# Altium project Master-Board-v2.0.PrjPcb (part 4 of 11)
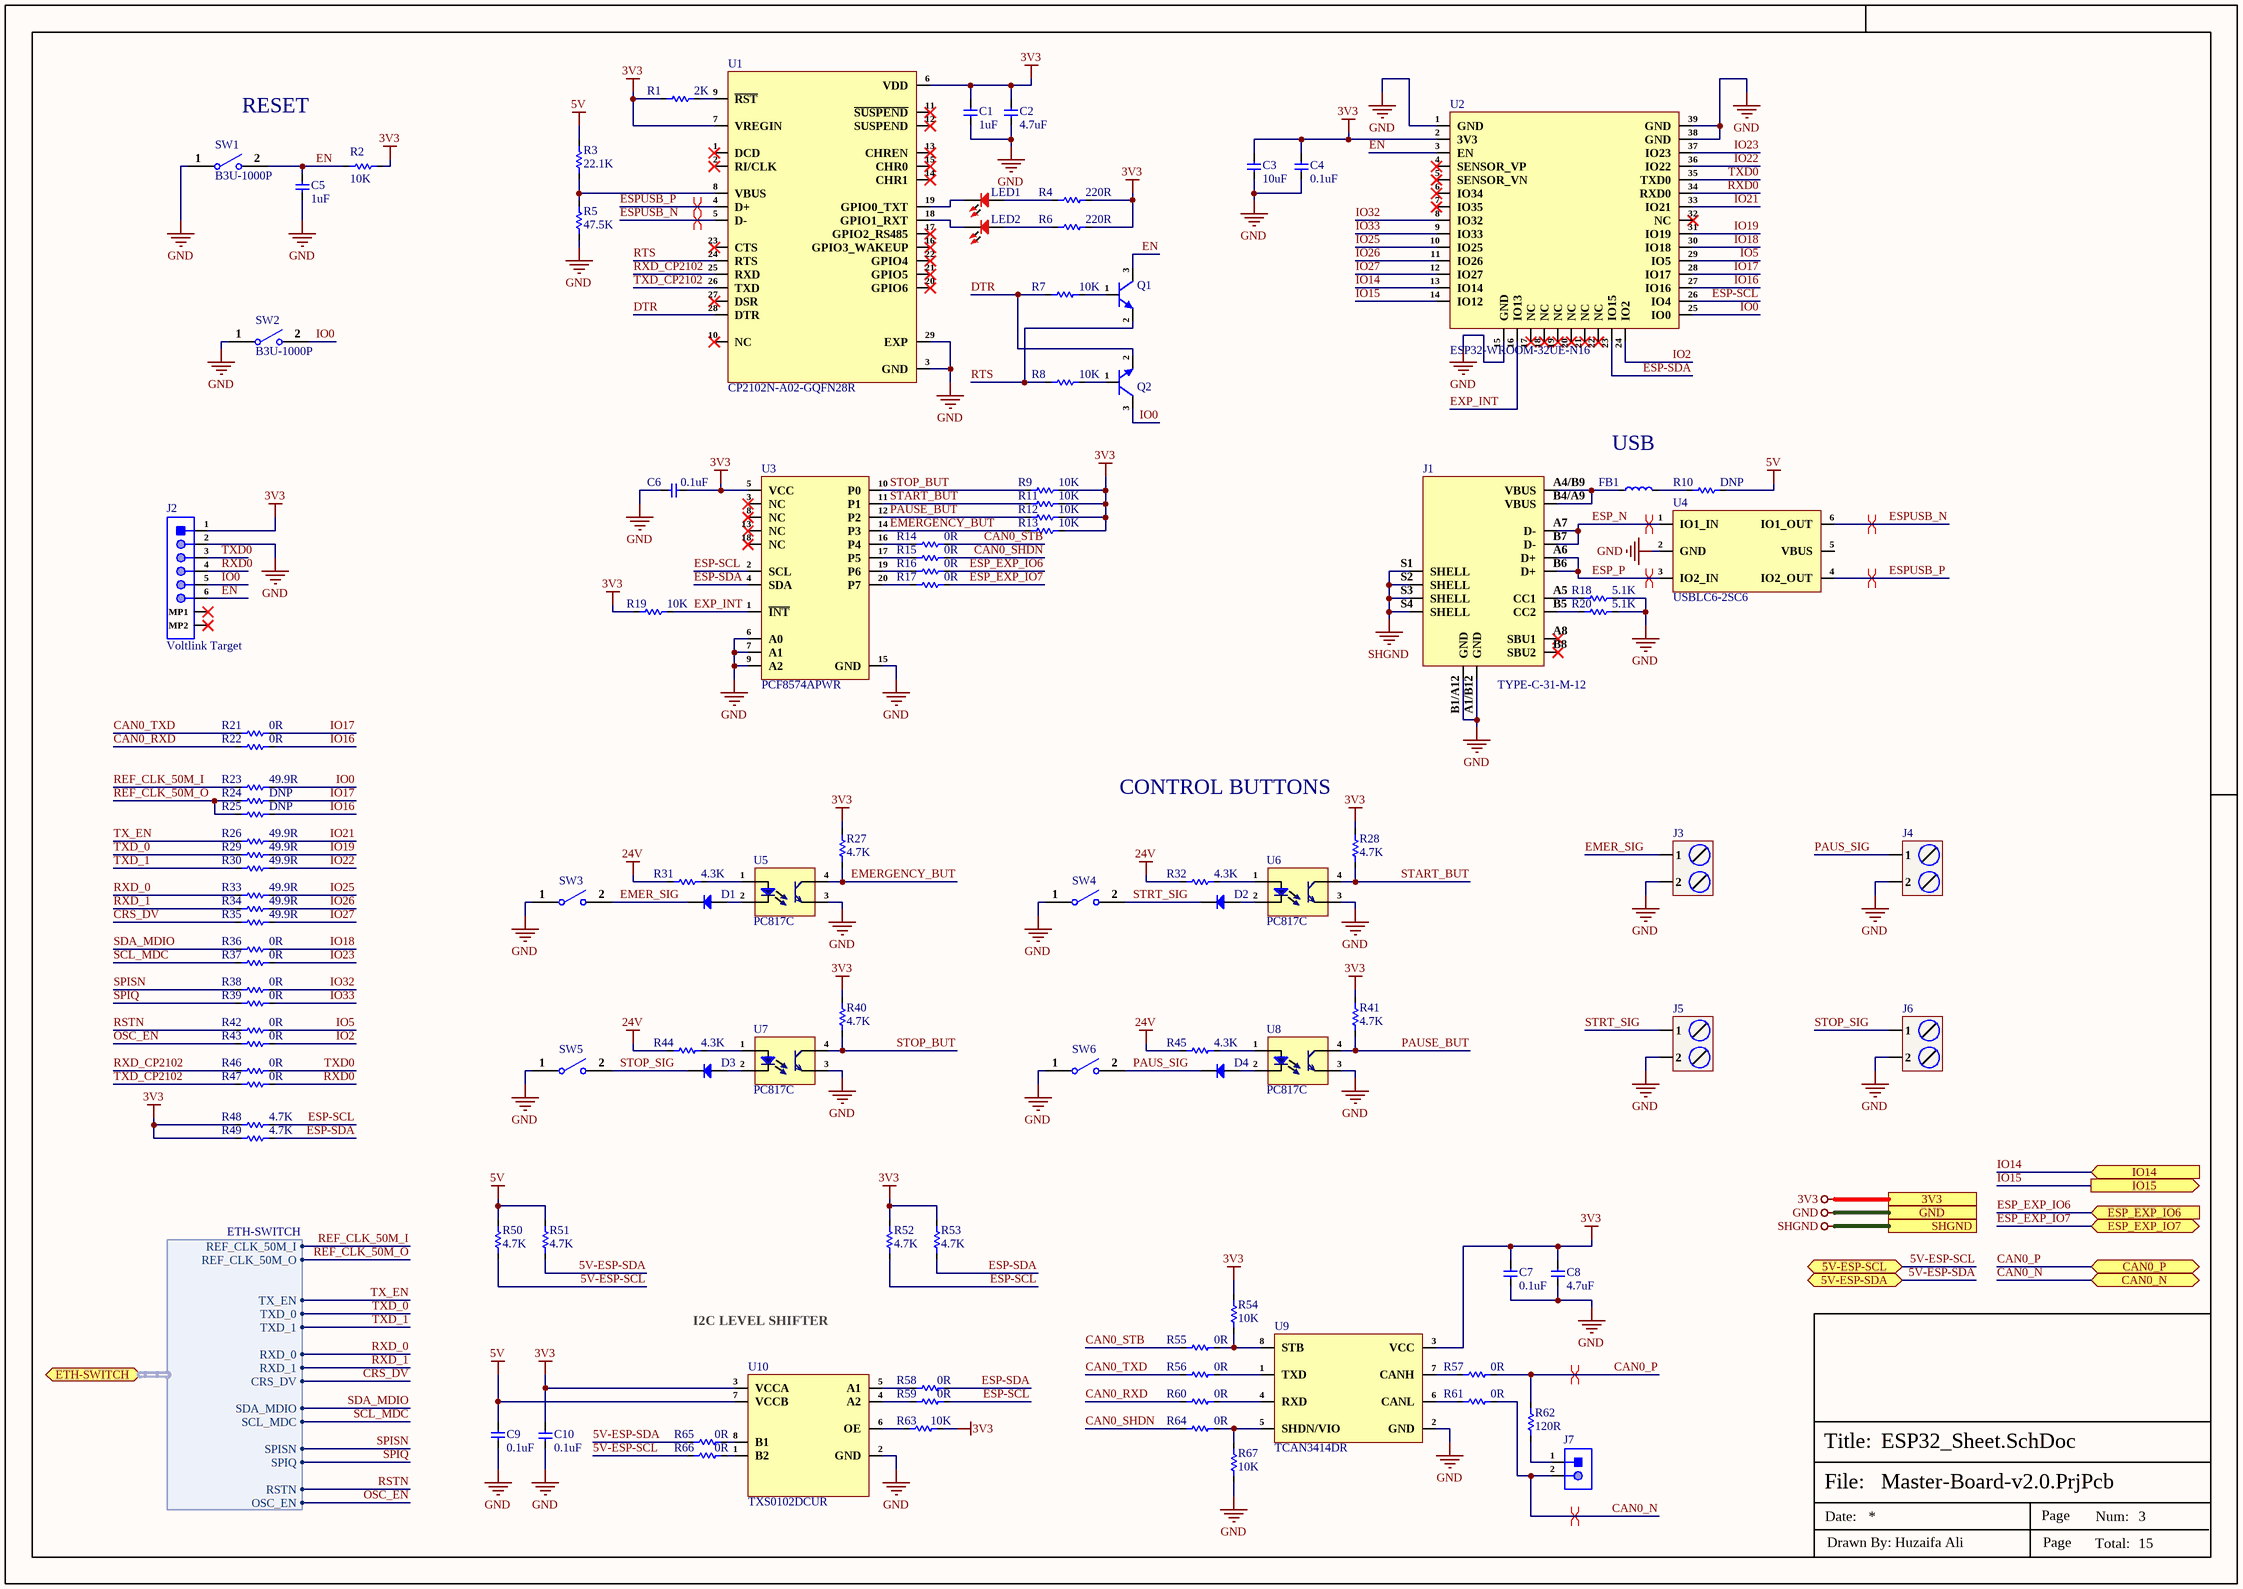
[diagram p104: ESP32_Sheet.SchDoc]

## Sheet ESP32_Sheet.SchDoc (continued)

### Library data of the parts (continued)
U5-U8 = PC817C: 70V 5kV 50mA 100mV@1mA,20mA 1 6V 1.2V DC SMD-4 Transistor Output Optocoupler ROHS; Manufacturer: Slkor; Item Type: IC; Manufacturer Part Number: PC817C; Package: SMD-4; LCSC Part Number: C2936043; ComponentLink1Description: LCSC; ComponentLink1URL: https://www.lcsc.com/product-detail/Transistor-Output-Optocoupler_Slkor-SLKORMICRO-Elec-PC817C_C2936043.html
U9 = TCAN3414DR: IC TRANSCEIVER HALF 1/1 8SOIC; Manufacturer: Texas Instruments; Supplier: Mouser; LCSC Part Number: C22396693; Manufacturer Part Number: TCAN3414DR; RoHS: No; Item Type: IC; Stock: 201; Pricing: 1=1.55, 10=1.1, 50=1.1, 100=0.895, 1000=0.763, 10000=0.681 (USD); Case/Package: SOIC; Pins: 8; Length: 4.9mm; Width: 3.91mm; Height: 1.75mm; Thickness: 1.58mm
U10 = TXS0102DCUR: IC TRANSLTR BIDIRECTIONAL 8VSSOP; Manufacturer: Texas Instruments; Number of Outputs: 2NUMBER; Number of Inputs: 2; Nominal Supply Current: 14.4uA; Output Current: 1A; Min Supply Voltage: 1.65V; Max Supply Voltage: 5.5V; Data Rate: 24Mbps; Propagation Delay: 4.6ns; Logic Function: Translator; Turn-On Delay Time: 260ns; High Level Output Current: -20uA; Low Level Output Current: 1mA; Number of Circuits: 1; Supplier: Mouser; Supplier Part Number: 595-TXS0102DCUR; Manufacturer Part Number: TXS0102DCUR; RoHS: Yes; Category: Voltage Level Shifters; Stock: 149802; Pricing: 1=0.89, 10=0.739, 50=0.739, 100=0.561, 1000=0.383, 10000=0.313 (USD); Case/Package: VSSOP; Pins: 8; Weight: 0.000339oz; Min Operating Temperature: -40°C; Max Operating Temperature: 85°C; Package Quantity: 3000; Number of Channels: 2; Packaging: Tape and Reel; Number of Bits: 2; Quiescent Current: 14.4uA; Series: -; Channel Type: Bidirectional; Length: 2.3mm; Width: 2mm; Height: 900um; Thickness: 850um; Radiation Hardening: No; Reach SVHC Compliant: No; Lead Free: Lead Free; RoHS Compliant: Yes; ComponentLink1URL: https://datasheet.ciiva.com/22653/1846850-22653373.pdf?src-supplier=Farnell; ComponentLink1Description: https://datasheet.ciiva.com/22653/1846850-22653373.pdf?src-supplier=Farnell; ComponentLink2URL: https://datasheet.ciiva.com/15096/getdatasheetpartid-118249-15096172.pdf?src-supplier=Verical; ComponentLink2Description: https://datasheet.ciiva.com/15096/getdatasheetpartid-118249-15096172.pdf?src-supplier=Verical; ComponentLink3URL: https://datasheet.ciiva.com/1508/1857232-1508821.pdf?src-supplier=Element14; ComponentLink3Description: https://datasheet.ciiva.com/1508/1857232-1508821.pdf?src-supplier=Element14; ComponentLink4URL: https://datasheet.ciiva.com/28499/1863639-28499676.pdf?src-supplier=Element14; ComponentLink4Description: https://datasheet.ciiva.com/28499/1863639-28499676.pdf?src-supplier=Element14; ComponentLink5URL: https://datasheet.ciiva.com/46395/1863639-46395871.pdf?src-supplier=Element14; ComponentLink5Description: https://datasheet.ciiva.com/46395/1863639-46395871.pdf?src-supplier=Element14; ComponentLink6URL: https://datasheet.ciiva.com/1899/txs0102-1899369.pdf?src-supplier=Digikey; ComponentLink6Description: https://datasheet.ciiva.com/1899/txs0102-1899369.pdf?src-supplier=Digikey; ComponentLink7URL: https://datasheet.ciiva.com/1899/txs0102-1899368.pdf?src-supplier=Digikey; ComponentLink7Description: https://datasheet.ciiva.com/1899/txs0102-1899368.pdf?src-supplier=Digikey; ComponentLink8URL: https://datasheet.ciiva.com/1899/txs0102-1899370.pdf?src-supplier=Digikey; ComponentLink8Description: https://datasheet.ciiva.com/1899/txs0102-1899370.pdf?src-supplier=Digikey; ComponentLink9URL: https://datasheet.ciiva.com/14287/txs0102-14287516.pdf?src-supplier=Avnet; ComponentLink9Description: https://datasheet.ciiva.com/14287/txs0102-14287516.pdf?src-supplier=Avnet; ComponentLink10URL: https://datasheet.ciiva.com/14287/txs0102-14287518.pdf?src-supplier=Avnet; ComponentLink10Description: https://datasheet.ciiva.com/14287/txs0102-14287518.pdf?src-supplier=Avnet; LCSC Part Number: C53434; Item Type: IC

## Sheet Ethernet-Sheet.SchDoc
size 420 x 297 mm; SheetNumber: 4; SheetTotal: 15
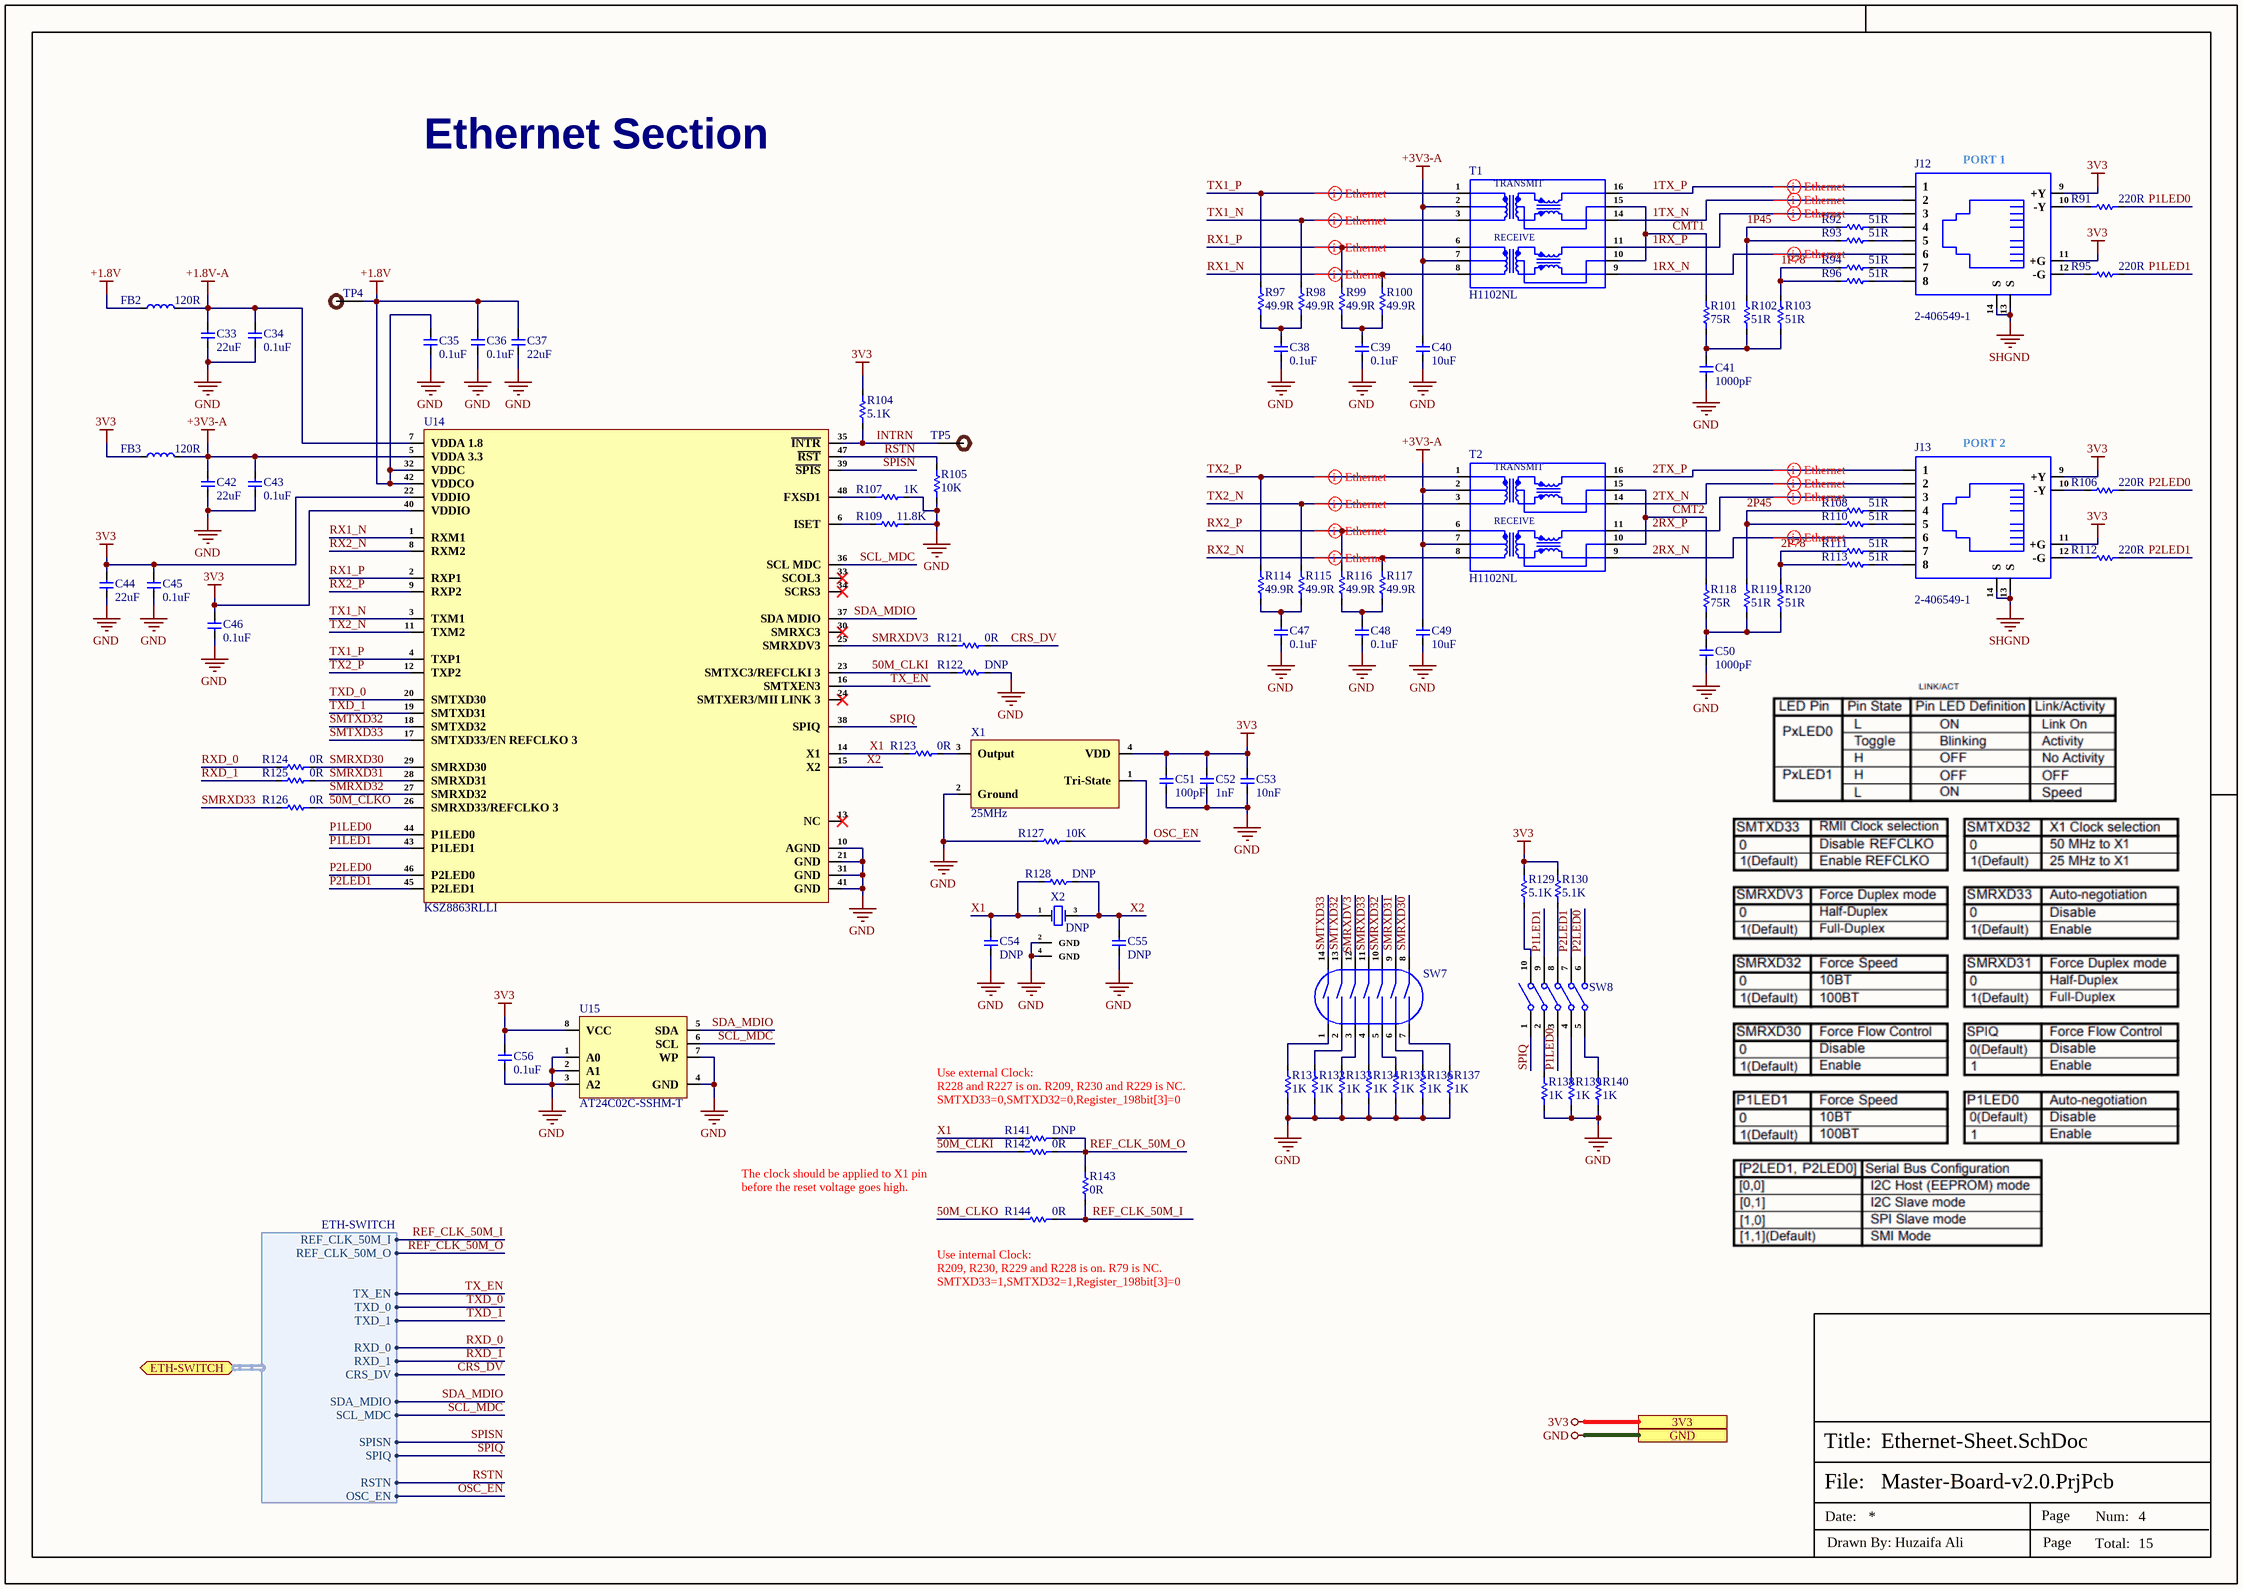
[diagram p3: Ethernet-Sheet.SchDoc]

### Parts
C33  22uF  [Cap-0805]
C34  0.1uF  [Cap-0402]
C35  0.1uF  [Cap-0402]
C36  0.1uF  [Cap-0402]
C37  22uF  [Cap-0805]
C38  0.1uF  [Cap-0402]
C39  0.1uF  [Cap-0402]
C40  10uF  [Cap-0603]
C41  1000pF  [Cap-1206]
C42  22uF  [Cap-0805]
C43  0.1uF  [Cap-0402]
C44  22uF  [Cap-0805]
C45  0.1uF  [Cap-0402]
C46  0.1uF  [Cap-0402]
C47  0.1uF  [Cap-0402]
C48  0.1uF  [Cap-0402]
C49  10uF  [Cap-0603]
C50  1000pF  [Cap-1206]
C51  100pF  [Cap-0402]
C52  1nF  [Cap-0402]
C53  10nF  [Cap-0402]
C54  DNP  [Cap-0402]
C55  DNP  [Cap-0402]
C56  0.1uF  [Cap-0402]
FB2  120R  [IND-0603 (1608 Metric)]
FB3  120R  [IND-0603 (1608 Metric)]
J12  2-406549-1  [2-406549-1]
J13  2-406549-1  [2-406549-1]
R91  220R  [Res-0603]
R92  51R  [Res-0603]
R93  51R  [Res-0603]
R94  51R  [Res-0603]
R95  220R  [Res-0603]
R96  51R  [Res-0603]
R97  49.9R  [Res-0603]
R98  49.9R  [Res-0603]
R99  49.9R  [Res-0603]
R100  49.9R  [Res-0603]
R101  75R  [Res-0603]
R102  51R  [Res-0603]
R103  51R  [Res-0603]
R104  5.1K  [Res-0402]
R105  10K  [Res-0402]
R106  220R  [Res-0603]
R107  1K  [Res-0402]
R108  51R  [Res-0603]
R109  11.8K  [Res-0603]
R110  51R  [Res-0603]
R111  51R  [Res-0603]
R112  220R  [Res-0603]
R113  51R  [Res-0603]
R114  49.9R  [Res-0603]
R115  49.9R  [Res-0603]
R116  49.9R  [Res-0603]
R117  49.9R  [Res-0603]
R118  75R  [Res-0603]
R119  51R  [Res-0603]
R120  51R  [Res-0603]
R121  0R  [Res-0402]
R122  DNP  [Res-0402]
R123  0R  [Res-0402]
R124  0R  [Res-0402]
R125  0R  [Res-0402]
R126  0R  [Res-0402]
R127  10K  [Res-0402]
R128  DNP  [Res-0402]
R129  5.1K  [Res-0402]
R130  5.1K  [Res-0402]
R131  1K  [Res-0402]
R132  1K  [Res-0402]
R133  1K  [Res-0402]
R134  1K  [Res-0402]
R135  1K  [Res-0402]
R136  1K  [Res-0402]
R137  1K  [Res-0402]
R138  1K  [Res-0402]
R139  1K  [Res-0402]
R140  1K  [Res-0402]
R141  DNP  [Res-0402]
R142  0R  [Res-0402]
R143  0R  [Res-0402]
R144  0R  [Res-0402]
SW7  DSIC07LS-P  [DSIC07LS-P]  (value not drawn)
SW8  DSIC05LS-P  [DSIC05LS-P_]  (value not drawn)
T1  H1102NL  [H1102NLT]
T2  H1102NL  [H1102NLT]
TP4  TEST POINT 0.5mm Dia  [Test-point - 0.5mm]  (value not drawn)  (no BOM)
TP5  TEST POINT 0.5mm Dia  [Test-point - 0.5mm]  (value not drawn)  (no BOM)
U14  KSZ8863RLLI  [48-LQFP (7x7)]
U15  AT24C02C-SSHM-T  [SOIC-8(0.154", 3.90mm Width)]
X1  25MHz  [SMD2520-4P]
X2  DNP  [Q22FA12800090]

### Ports
3V3 (see Top-Sheet[2B], CAN-Sheet[5D], Controller-Sheet-1[4D], Controller-Sheet-2[4D], Controller-Sheet-3[4D], DIOs-Lights-Sensors-Sheet[4D], Display-Sheet[5D], ESP32_Sheet[6D], EtherCAT-Sheet[1D], Power-Sheet[4D], RS232-Sheet[5D], RS485-Sheet[5D], STM32-USB-Sheet[4D]), ETH-SWITCH (bidir, harness ETH-SWITCH, see Top-Sheet[2B], ESP32_Sheet[1D]), GND (see Top-Sheet[2B], Analog-AIO-Sheet[5D], CAN-Sheet[6D], Controller-Sheet-1[4D], Controller-Sheet-2[4D], Controller-Sheet-3[4D], DIOs-Lights-Sensors-Sheet[4D], Display-Sheet[5D], ESP32_Sheet[6D], EtherCAT-Sheet[1D], Power-Sheet[4D], RS232-Sheet[5D], RS485-Sheet[5D], STM32-USB-Sheet[4D])

### Harnesses
ETH-SWITCH: REF_CLK_50M_I, REF_CLK_50M_O, TX_EN, TXD_0, TXD_1, RXD_0, RXD_1, CRS_DV, SDA_MDIO, SCL_MDC, SPISN, SPIQ, RSTN, OSC_EN

### Nets
3V3: C44.2 C45.2 C46.2 C51.2 C52.2 C53.2 C56.2 FB3.1 J12.9(+Y) J12.11(+G) J13.9(+Y) J13.11(+G) R104.2 R129.2 R130.2 U14.22(VDDIO) U14.40(VDDIO) U15.8(VCC) X1.4(VDD) ; port 3V3
+1.8V: C35.2 C36.2 C37.2 FB2.1 TP4.1 U14.32(VDDC) U14.42(VDDCO)
+1.8V-A: C33.2 C34.2 FB2.2 U14.7(VDDA_1.8)
+3V3-A: C40.2 C42.2 C43.2 C49.2 FB3.2 T1.2 T1.7 T2.2 T2.7 U14.5(VDDA_3.3)
GND: C33.1 C34.1 C35.1 C36.1 C37.1 C38.1 C39.1 C40.1 C41.1 C42.1 C43.1 C44.1 C45.1 C46.1 C47.1 C48.1 C49.1 C50.1 C51.1 C52.1 C53.1 C54.1 C55.1 C56.1 R105.1 R107.1 R109.2 R122.2 R127.1 R131.1 R132.1 R133.1 R134.1 R135.1 R136.1 R137.1 R138.1 R139.1 R140.1 U14.10(AGND) U14.21(GND) U14.31(GND) U14.41(GND) U15.1(A0) U15.2(A1) U15.3(A2) U15.4(GND) U15.7(WP) X1.2(Ground) X2.2(GND) X2.4(GND) ; port GND
SHGND: J12.13(S) J12.14(S) J13.13(S) J13.14(S)
1P45: R92.2 R93.2 R102.2
1P78: R94.2 R96.2 R103.2
1RX_N: J12.6 T1.9
1RX_P: J12.3 T1.11
1TX_N: J12.2 T1.14
1TX_P: J12.1 T1.16
2P45: R108.2 R110.2 R119.2
2P78: R111.2 R113.2 R120.2
2RX_N: J13.6 T2.9
2RX_P: J13.3 T2.11
2TX_N: J13.2 T2.14
2TX_P: J13.1 T2.16
50M_CLKI: R122.1 R142.1 U14.23(SMTXC3/REFCLKI_3)
50M_CLKO: R126.2 R144.1 U14.26(SMRXD33/REFCLKO_3)
CMT1: R101.2 T1.10 T1.15
CMT2: R118.2 T2.10 T2.15
CRS_DV: R121.2 ; port ETH-SWITCH.CRS_DV
INTRN: R104.1 TP5.1 U14.35(~{INTR})
OSC_EN: R127.2 X1.1(Tri-State) ; port ETH-SWITCH.OSC_EN
P1LED0: R91.2 SW8.3 U14.44(P1LED0)
P1LED1: R95.2 SW8.9 U14.43(P1LED1)
P2LED0: R106.2 SW8.6 U14.46(P2LED0)
P2LED1: R112.2 SW8.7 U14.45(P2LED1)
REF_CLK_50M_I: R143.1 R144.2 ; port ETH-SWITCH.REF_CLK_50M_I
REF_CLK_50M_O: R141.2 R142.2 R143.2 ; port ETH-SWITCH.REF_CLK_50M_O
RSTN: R105.2 U14.47(~{RST}) ; port ETH-SWITCH.RSTN
RX1_N: R100.2 T1.8 U14.1(RXM1)
RX1_P: R99.2 T1.6 U14.2(RXP1)
RX2_N: R117.2 T2.8 U14.8(RXM2)
RX2_P: R116.2 T2.6 U14.9(RXP2)
RXD_0: R124.1 ; port ETH-SWITCH.RXD_0
RXD_1: R125.1 ; port ETH-SWITCH.RXD_1
SCL_MDC: U14.36(SCL_MDC) U15.6(SCL) ; port ETH-SWITCH.SCL_MDC
SDA_MDIO: U14.37(SDA_MDIO) U15.5(SDA) ; port ETH-SWITCH.SDA_MDIO
SMRXD30: R124.2 SW7.8 U14.29(SMRXD30)
SMRXD31: R125.2 SW7.9 U14.28(SMRXD31)
SMRXD32: SW7.10 U14.27(SMRXD32)
SMRXD33: R126.1 SW7.11
SMRXDV3: R121.1 SW7.12 U14.25(SMRXDV3)
SMTXD32: SW7.13 U14.18(SMTXD32)
SMTXD33: SW7.14 U14.17(SMTXD33/EN_REFCLKO_3)
SPIQ: SW8.1 U14.38(SPIQ) ; port ETH-SWITCH.SPIQ
SPISN: U14.39(~{SPIS}) ; port ETH-SWITCH.SPISN
TX1_N: R98.2 T1.3 U14.3(TXM1)
TX1_P: R97.2 T1.1 U14.4(TXP1)
TX2_N: R115.2 T2.3 U14.11(TXM2)
TX2_P: R114.2 T2.1 U14.12(TXP2)
TX_EN: U14.16(SMTXEN3) ; port ETH-SWITCH.TX_EN
TXD_0: U14.20(SMTXD30) ; port ETH-SWITCH.TXD_0
TXD_1: U14.19(SMTXD31) ; port ETH-SWITCH.TXD_1
X1: C54.2 R123.1 R128.1 R141.1 U14.14(X1) X2.1(OSC1)
X2: C55.2 R128.2 U14.15(X2) X2.3(OSC2)
NetC38_2: C38.2 R97.1 R98.1
NetC39_2: C39.2 R99.1 R100.1
NetC41_2: C41.2 R101.1 R102.1 R103.1
NetC47_2: C47.2 R114.1 R115.1
NetC48_2: C48.2 R116.1 R117.1
NetC50_2: C50.2 R118.1 R119.1 R120.1
NetJ12_4: J12.4 R92.1
NetJ12_5: J12.5 R93.1
NetJ12_7: J12.7 R94.1
NetJ12_8: J12.8 R96.1
NetJ12_10: J12.10(-Y) R91.1
NetJ12_12: J12.12(-G) R95.1
NetJ13_4: J13.4 R108.1
NetJ13_5: J13.5 R110.1
NetJ13_7: J13.7 R111.1
NetJ13_8: J13.8 R113.1
NetJ13_10: J13.10(-Y) R106.1
NetJ13_12: J13.12(-G) R112.1
NetR107_2: R107.2 U14.48(FXSD1)
NetR109_1: R109.1 U14.6(ISET)
NetR123_2: R123.2 X1.3(Output)
NetR129_1: R129.1 SW8.10
NetR130_1: R130.1 SW8.8
NetR131_2: R131.2 SW7.1
NetR132_2: R132.2 SW7.2
NetR133_2: R133.2 SW7.3
NetR134_2: R134.2 SW7.4
NetR135_2: R135.2 SW7.5
NetR136_2: R136.2 SW7.6
NetR137_2: R137.2 SW7.7
NetR138_2: R138.2 SW8.2
NetR139_2: R139.2 SW8.4
NetR140_2: R140.2 SW8.5

Not connected (* = marked no-connect by the designer): U14 13(NC)* 24(SMTXER3/MII_LINK_3)* 30(SMRXC3)* 33(SCOL3)* 34(SCRS3)*

### Layout directives
differential pair; differential pair class Ethernet-1 A Lines; rule Impedance Constraint [Min = 97.00    Max = 103.0    ]; rule Matched Net Lengths [Tolerance = 0.508mm]: 1RX_N, 1RX_P, 1TX_N, 1TX_P
differential pair; differential pair class Ethernet-1 B Lines; rule Impedance Constraint [Min = 97.00    Max = 103.0    ]; rule Matched Net Lengths [Tolerance = 0.508mm]: RX1_N, RX1_P, TX1_N, TX1_P
differential pair; differential pair class Ethernet-2 A Lines; rule Impedance Constraint [Min = 97.00    Max = 103.0    ]; rule Matched Net Lengths [Tolerance = 0.508mm]: 2RX_N, 2RX_P, 2TX_N, 2TX_P
differential pair; differential pair class Ethernet-2 B Lines; rule Impedance Constraint [Min = 97.00    Max = 103.0    ]; rule Matched Net Lengths [Tolerance = 0.508mm]: RX2_N, RX2_P, TX2_N, TX2_P

### Notes on the sheet
- Ethernet Section
- (near J12) PORT 1
- (near J13) PORT 2
- Use external Clock:
  R228 and R227 is on. R209, R230 and R229 is NC.
  SMTXD33=0,SMTXD32=0,Register_198bit[3]=0
- The clock should be applied to X1 pin before the reset voltage goes high.
- (near R144) Use internal Clock:
  R209, R230, R229 and R228 is on. R79 is NC.
  SMTXD33=1,SMTXD32=1,Register_198bit[3]=0
- File:
- Title:
- Date:
- Page
- Num:
- Total:
- Drawn By: Huzaifa Ali
- (in symbol H1102NL) TRANSMIT; RECEIVE